# Altium schematic sheet PGA900_AFE_Reserved_4.SchDoc: =DT_SCH_Title
size A4; Organization: Droid Technologies; SheetNumber: 16; SheetTotal: 22
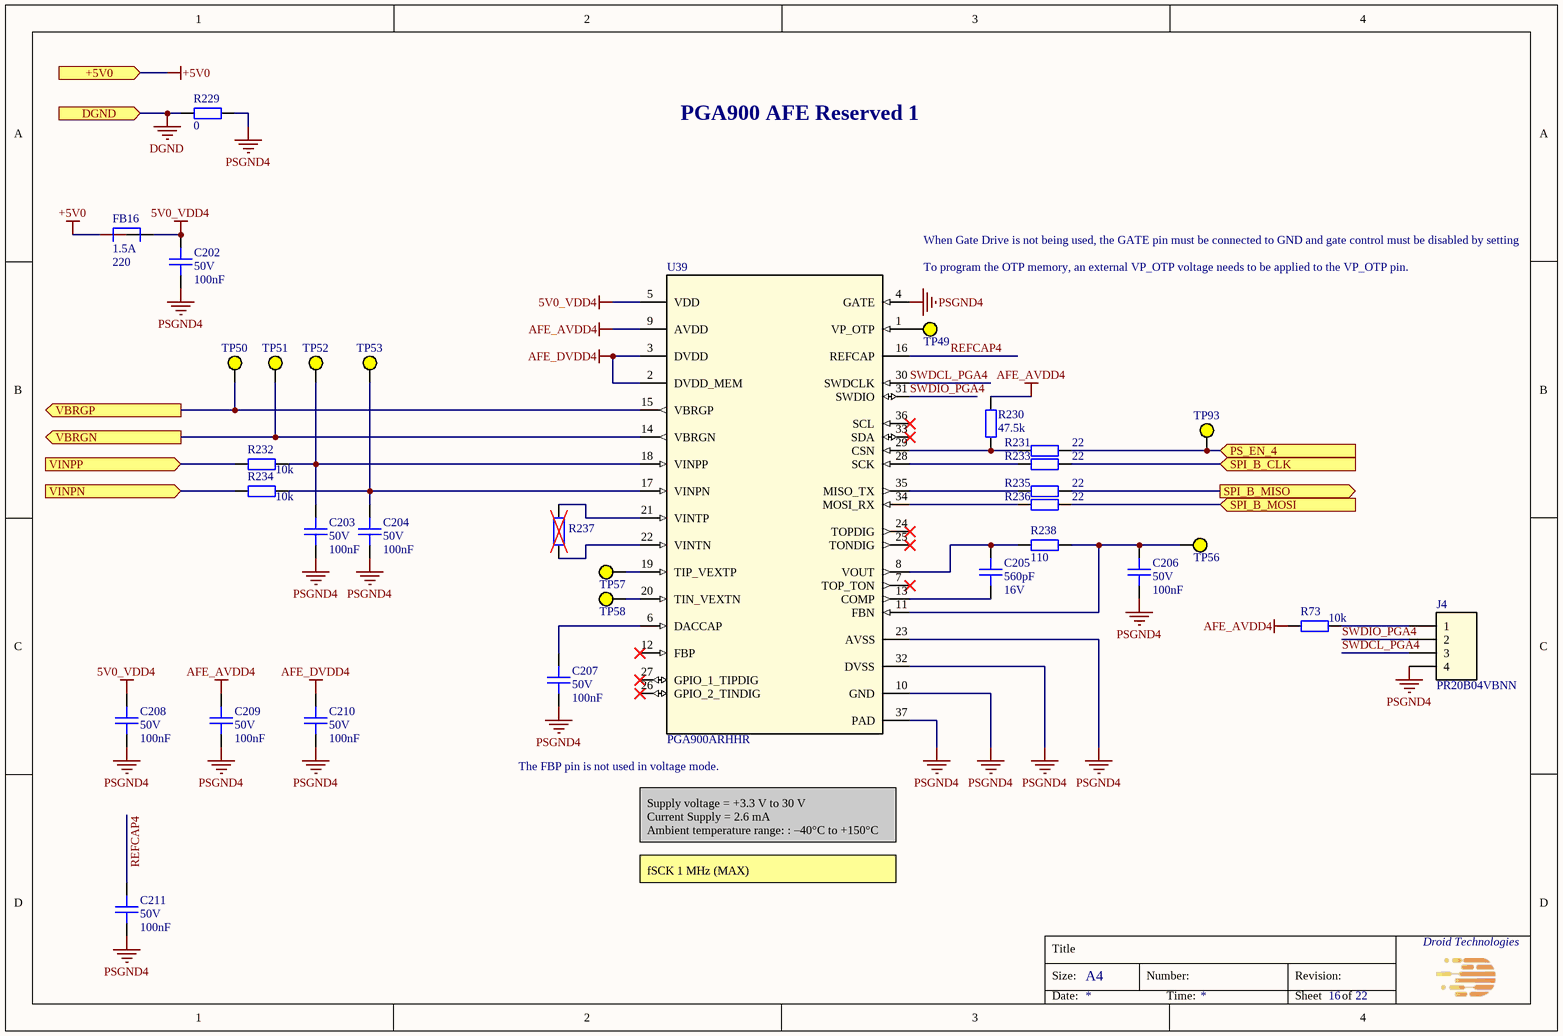
[diagram p0: PGA900_AFE_Reserved_4.SchDoc]

## Parts
C202  Voltage Rating: 50V  Capacitance: 100nF  [CAPC100x50x50L25]  (hidden comment: GCM155L8EH104KE07D)
C203  Voltage Rating: 50V  Capacitance: 100nF  [CAPC100x50x50L25]  (hidden comment: GCM155L8EH104KE07D)
C204  Voltage Rating: 50V  Capacitance: 100nF  [CAPC100x50x50L25]  (hidden comment: GCM155L8EH104KE07D)
C205  Capacitance: 560pF  Voltage Rating: 16V  [CAPC100x50x50L25]  (hidden comment: C0402C561F4HACAUTO)
C206  Voltage Rating: 50V  Capacitance: 100nF  [CAPC100x50x50L25]  (hidden comment: GCM155L8EH104KE07D)
C207  Voltage Rating: 50V  Capacitance: 100nF  [CAPC100x50x50L25]  (hidden comment: GCM155L8EH104KE07D)
C208  Voltage Rating: 50V  Capacitance: 100nF  [CAPC100x50x50L25]  (hidden comment: GCM155L8EH104KE07D)
C209  Voltage Rating: 50V  Capacitance: 100nF  [CAPC100x50x50L25]  (hidden comment: GCM155L8EH104KE07D)
C210  Voltage Rating: 50V  Capacitance: 100nF  [CAPC100x50x50L25]  (hidden comment: GCM155L8EH104KE07D)
C211  Voltage Rating: 50V  Capacitance: 100nF  [CAPC100x50x50L25]  (hidden comment: GCM155L8EH104KE07D)
FB16  Imax: 1.5A  Impedance: 220  [BEADC160X80X95L40]  (hidden comment: BLM18KG221BH1D)
J4  PR20B04VBNN  [M50-3530442]
R73  Resistance: 10k  [RESC100X50X40L25]  (hidden comment: RC0402FR-0710KL)
R229  Resistance: 0  [RESC160X80X55L30]  (hidden comment: RC0603FR-070RL)
R230  Resistance: 47.5k  [RESC100X50X40L25]  (hidden comment: RC0402FR-0747K5L)
R231  Resistance: 22  [RESC100X50X40L25]  (hidden comment: RC0402FR-0722RL)
R232  Resistance: 10k  [RESC100X50X40L25]  (hidden comment: RC0402FR-0710KL)
R233  Resistance: 22  [RESC100X50X40L25]  (hidden comment: RC0402FR-0722RL)
R234  Resistance: 10k  [RESC100X50X40L25]  (hidden comment: RC0402FR-0710KL)
R235  Resistance: 22  [RESC100X50X40L25]  (hidden comment: RC0402FR-0722RL)
R236  Resistance: 22  [RESC100X50X40L25]  (hidden comment: RC0402FR-0722RL)
R237  DNP chip res 0603  [RESC160X80X55L30]  (value not drawn)
R238  Resistance: 110  [RESC100X50X40L25]  (hidden comment: RC0402FR-07110RL)
TP49  Test Point  [TP_D1.5mm]  (value not drawn)  (no BOM)
TP50  Test Point  [TP_D0.75mm]  (value not drawn)  (no BOM)
TP51  Test Point  [TP_D0.75mm]  (value not drawn)  (no BOM)
TP52  Test Point  [TP_D0.75mm]  (value not drawn)  (no BOM)
TP53  Test Point  [TP_D0.75mm]  (value not drawn)  (no BOM)
TP56  Test Point  [TP_D0.75mm]  (value not drawn)  (no BOM)
TP57  Test Point  [TP_D1.5mm]  (value not drawn)  (no BOM)
TP58  Test Point  [TP_D1.5mm]  (value not drawn)  (no BOM)
TP93  Test Point  [TP_D0.75mm]  (value not drawn)  (no BOM)
U39  PGA900ARHHR  [36VQFN]

## Ports
+5V0 (in), DGND (in), PS_EN_4 (in), SPI_B_CLK (in), SPI_B_MISO (out), SPI_B_MOSI (in), VBRGN (out), VBRGP (out), VINPN (in), VINPP (in)

## Nets
5V0_VDD4: C202.2 C208.2 FB16.2 U39.5(VDD)
+5V0: FB16.1 ; port +5V0
AFE_AVDD4: C209.2 R73.2 R230.2 U39.9(AVDD)
AFE_DVDD4: C210.2 U39.2(DVDD_MEM) U39.3(DVDD)
DGND: R229.2 ; port DGND
PSGND4: C202.1 C203.1 C204.1 C206.1 C207.1 C208.1 C209.1 C210.1 C211.1 J4.4 R229.1 U39.4(GATE) U39.10(GND) U39.23(AVSS) U39.32(DVSS) U39.37(PAD)
PS_EN_4: R231.2 TP93.1 ; port PS_EN_4
REFCAP4: C211.2 U39.16(REFCAP)
SPI_B_CLK: R233.2 ; port SPI_B_CLK
SPI_B_MISO: R235.2 ; port SPI_B_MISO
SPI_B_MOSI: R236.2 ; port SPI_B_MOSI
SWDCL_PGA4: J4.3 U39.30(SWDCLK)
SWDIO_PGA4: J4.2 U39.31(SWDIO)
VBRGN: TP51.1 U39.14(VBRGN) ; port VBRGN
VBRGP: TP50.1 U39.15(VBRGP) ; port VBRGP
VINPN: R234.1 ; port VINPN
VINPP: R232.1 ; port VINPP
NetC203_2: C203.2 R232.2 TP52.1 U39.18(VINPP)
NetC204_2: C204.2 R234.2 TP53.1 U39.17(VINPN)
NetC205_1: C205.1 U39.13(COMP)
NetC205_2: C205.2 R238.1 U39.8(VOUT)
NetC206_2: C206.2 R238.2 TP56.1 U39.11(FBN)
NetC207_2: C207.2 U39.6(DACCAP)
NetJ4_1: J4.1 R73.1
NetR230_1: R230.1 R231.1 U39.29(CSN)
NetR233_1: R233.1 U39.28(SCK)
NetR235_1: R235.1 U39.35(MISO_TX)
NetR236_1: R236.1 U39.34(MOSI_RX)
NetR237_1: R237.1 U39.22(VINTN)
NetR237_2: R237.2 U39.21(VINTP)
NetTP49_1: TP49.1 U39.1(VP_OTP)
NetTP57_1: TP57.1 U39.19(TIP_VEXTP)
NetTP58_1: TP58.1 U39.20(TIN_VEXTN)

Not connected (* = marked no-connect by the designer): U39 7(TOP_TON)* 12(FBP)* 24(TOPDIG)* 25(TONDIG)* 26(GPIO_2_TINDIG)* 27(GPIO_1_TIPDIG)* 33(SDA)* 36(SCL)*

## Notes on the sheet
- PGA900 AFE Reserved 1
- When Gate Drive is not being used, the GATE pin must be connected to GND and gate control must be disabled by setting
- To program the OTP memory, an external VP_OTP voltage needs to be applied to the VP_OTP pin.
- (near U39) The FBP pin is not used in voltage mode.
- Supply voltage = +3.3 V to 30 V
  Current Supply = 2.6 mA
  Ambient temperature range: : –40°C to +150°C
- fSCK 1 MHz (MAX)
- Title
- Size:
- A4
- Number:
- Revision:
- Date:
- Time:
- Sheet
- of

## Library data of the parts
C202-C204 C206-C211 = CMP-001-1980-2: CAP CER 0.1UF 50V X8L 0402; Manufacturer: Murata Electronics; Op Temp max: 150°C; Op Temp min: -55°C; Tolerance: 10%; Height max: 550µm; ComponentLink3Description: Digikey; Mounting Type: SM; ComponentLink3URL: https://www.digikey.com/en/products/detail/murata-electronics/GCM155L8EH104KE07D/11618823; Package: 0402 (1005 Metric); Lead Spacing: 0mm; MPN: GCM155L8EH104KE07D; Size: 1.00mm x 0.50mm; Ratings: AEC-Q200; ComponentLink1URL: https://www.murata.com/en-us/products/productdetail?partno=GCM155L8EH104KE07%23; ComponentLink1Description: Datasheet; Dielectric: X8L; ComponentLink2Description: Mouser; ComponentLink2URL: https://eu.mouser.com/ProductDetail/Murata-Electronics/GCM155L8EH104KE07D?qs=1mbolxNpo8fQSHf0HYnZWw%3D%3D
C205 = CMP-001-2011-2: CAP CER 0402 560PF 16V ULTRA STA; Manufacturer: KEMET; Dielectric: X8R; Tolerance: 1%; Op Temp max: 150°C; Op Temp min: -55°C; Package: 0402 (1005 Metric); MPN: C0402C561F4HACAUTO; ComponentLink3Description: Digikey; Mounting Type: SM; Height max: 550µm; Lead Spacing: 0mm; ComponentLink1Description: Datasheet; ComponentLink3URL: https://www.digikey.com/en/products/detail/kemet/C0402C561F4HACAUTO/7955183?s=N4IgjCBcpgbFoDGUBmBDANgZwKYBoQB7KAbRAGYBOMAVgA4QBdAgBwBcoQBlNgJwEsAdgHMQAXwJgA7AhDJI6bPiKkQAFgBMGzfGYh2nHgJHiCGmhtnzFuAsUhltGyuQh6DkbnyGiJ4SnSUVqiYtioOIAAMTH4akWpB0HIhSnaqNLCRAAQsAGJMrByeAKqC-GwA8igAsjhoWACuvDimIAC0lknyfA3K9mQ0MbHpmSwoMUA; ComponentLink2URL: https://eu.mouser.com/ProductDetail/KEMET/C0402C561F4HACAUTO?qs=j%252B1pi9TdxUZljUlO6hXHJQ%3D%3D; ComponentLink2Description: Mouser; ComponentLink1URL: https://www.kemet.com/en/us/product/C0402C561F4HACAUTO.html; Ratings: AEC-Q200; Size: 1.00mm x 0.50mm
FB16 = CMP-001-1981-1: FERRITE BEAD 220 OHM 0603 1LN; Manufacturer: Murata Electronics; DCR: 50m; Op Temp min: -55°C; Frequency: 100MHz; Op Temp max: 150°C; Number of Lines: 1; Mounting Type: SM; Size: 1.60mm x 0.80mm; ComponentLink2URL: https://eu.mouser.com/ProductDetail/Murata-Electronics/BLM18KG221BH1D?qs=sJ5gq5MLFXpgEHYBdWUtkQ%3D%3D; ComponentLink1Description: Datasheet; ComponentLink1URL: https://www.murata.com/en-us/products/productdata/8798137286686/QNFA9129.pdf; Lead Spacing: 0mm; Ratings: AEC-Q200; ComponentLink3Description: Digikey; ComponentLink3URL: https://www.digikey.com/en/products/detail/murata-electronics/BLM18KG221BH1D/6156000; Height max: 950µm; Package: 0603 (1608 Metric); ComponentLink2Description: Mouser; MPN: BLM18KG221BH1D
J4 = M50-3530442: Connector Header Through Hole 4 position 0.050" (1.27mm); Manufacturer: METZ CONNECT USA Inc.; MPN: PR20B04VBNN; ComponentLink1Description: Datasheet; ComponentLink1URL: https://www.lcsc.com/datasheet/C3326047.pdf; ComponentLink2Description: DigiKey; ComponentLink2URL: https://www.digikey.com/en/products/detail/metz-connect-usa-inc/PR20B04VBNN/12342910
R73 R232 R234 = CMP-00010-6: RES 10K OHM 1% 1/16W 0402; Manufacturer: YAGEO; Op Temp max: 155°C; Op Temp min: -55°C; Power: 63mW; Temperature Coefficient: ±100ppm; ComponentLink3URL: https://www.digikey.com/en/products/detail/yageo/RC0402FR-0710KL/726523; ComponentLink1Description: Datasheet; Height max: 400µm; ComponentLink3Description: Digikey; ComponentLink2URL: https://www2.mouser.com/ProductDetail/YAGEO/RC0402FR-0710KL?qs=%2Fha2pyFaduhjtLcYvKXQ8NAGbRXkQ%2Fwl6RsvWHeV66MSeqLhkcF3rg%3D%3D; Ratings: -; MPN: RC0402FR-0710KL; ComponentLink1URL: https://www.yageo.com/upload/media/product/productsearch/datasheet/rchip/PYu-RC_Group_51_RoHS_L_12.pdf; ComponentLink2Description: Mouser; Mounting Type: SM; Tolerance: 1%; Composition: Thick Film; Size: 1.00mm x 0.50mm; Package: 0402 (1005 Metric)
R229 = CMP-001-0927-2: RES 0 OHM JUMPER 1/10W 0603; Manufacturer: YAGEO; Op Temp min: -55°C; Op Temp max: 155°C; Power: 100mW; Tolerance: 0%; Height max: 550µm; ComponentLink2URL: https://eu.mouser.com/ProductDetail/YAGEO/RC0603FR-070RL?qs=0yPvnVz5%2FmpDQv43TwvCfw%3D%3D; Temperature Coefficient: -; ComponentLink3Description: Digikey; ComponentLink2Description: Mouser; MPN: RC0603FR-070RL; ComponentLink1URL: https://www.yageo.com/upload/media/product/productsearch/datasheet/rchip/PYu-RC_Group_51_RoHS_L_12.pdf; Ratings: -; Size: 1.60mm x 0.80mm; Composition: Thick Film; Mounting Type: SM; ComponentLink3URL: https://www.digikey.com/en/products/detail/yageo/RC0603FR-070RL/1304008; Package: 0603 (1608 Metric); ComponentLink1Description: Datasheet
R230 = CMP-001-0277-7: RES 47.5K OHM 1% 1/16W 0402; Manufacturer: YAGEO; Op Temp min: -55°C; Power: 63mW; Temperature Coefficient: ±100ppm; Op Temp max: 155°C; ComponentLink1URL: https://www.yageo.com/upload/media/product/productsearch/datasheet/rchip/PYu-RC_Group_51_RoHS_L_12.pdf; ComponentLink1Description: Datasheet; MPN: RC0402FR-0747K5L; ComponentLink3Description: Digikey; ComponentLink2URL: https://eu.mouser.com/ProductDetail/YAGEO/RC0402FR-0747K5L?qs=V1yeUXFNrklfu86Rfgihxg%3D%3D; Mounting Type: SM; Tolerance: 1%; Package: 0402 (1005 Metric); Height max: 400µm; ComponentLink2Description: Mouser; ComponentLink3URL: https://www.digikey.com/en/products/detail/yageo/RC0402FR-0747K5L/726617; Size: 1.00mm x 0.50mm; Composition: Thick Film; Ratings: -
R231 R233 R235 R236 = CMP-001-0482-4: RES 22 OHM 1% 1/16W 0402; Manufacturer: YAGEO; Temperature Coefficient: ±100ppm; Op Temp max: 155°C; Op Temp min: -55°C; Power: 63mW; Ratings: -; ComponentLink3URL: https://www.digikey.com/en/products/detail/yageo/RC0402FR-0722RL/726562; ComponentLink2URL: https://eu.mouser.com/ProductDetail/YAGEO/RC0402FR-0722RL?qs=V1yeUXFNrkkRg6zf08ADKQ%3D%3D; MPN: RC0402FR-0722RL; ComponentLink1Description: Datasheet; ComponentLink3Description: Digikey; Tolerance: 1%; Size: 1.00mm x 0.50mm; ComponentLink1URL: https://www.yageo.com/upload/media/product/productsearch/datasheet/rchip/PYu-RC_Group_51_RoHS_L_12.pdf; Composition: Thick Film; ComponentLink2Description: Mouser; Mounting Type: SM; Package: 0402 (1005 Metric); Height max: 400µm
R237 = CMP-001-0920-3: DNP res 0603; Mounting Type: SM; MPN: DNP; Package: 0603 (1608 Metric)
R238 = CMP-001-0497-6: RES 110 OHM 1% 1/16W 0402; Manufacturer: YAGEO; Power: 63mW; Op Temp min: -55°C; Op Temp max: 155°C; Temperature Coefficient: ±100ppm; Size: 1.00mm x 0.50mm; ComponentLink1Description: Datasheet; Package: 0402 (1005 Metric); ComponentLink2URL: https://eu.mouser.com/ProductDetail/YAGEO/RC0402FR-07110RL?qs=QWYorlrD8IXj7iGvwWbRbA%3D%3D; MPN: RC0402FR-07110RL; ComponentLink3Description: Digikey; Height max: 400µm; Ratings: -; ComponentLink3URL: https://www.digikey.com/en/products/detail/yageo/RC0402FR-07110RL/2827583; Composition: Thick Film; ComponentLink2Description: Mouser; Tolerance: 1%; Mounting Type: SM; ComponentLink1URL: https://www.yageo.com/upload/media/product/productsearch/datasheet/rchip/PYu-RC_Group_51_RoHS_L_12.pdf
TP49 TP57 TP58 = TP_1.5
TP50-TP53 TP56 TP93 = TP_0.75: Test point 0.75mm
U39 = PGA900ARHHR: IC PROG SENSOR SGNL COND 36VQFN; Manufacturer: Texas Instruments; MPN: PGA900ARHHR